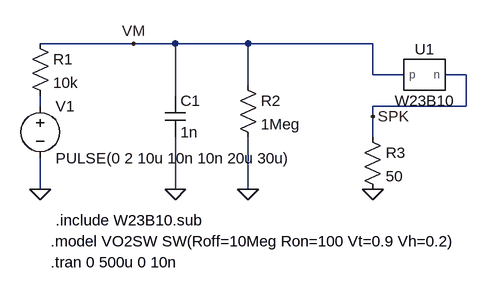
[diagram p0: schematic lif-tiox.asc]
lif-tiox.asc, the LTspice schematic file:
Version 4
SHEET 1 880 680
WIRE 224 128 80 128
WIRE 288 128 224 128
WIRE 400 128 288 128
WIRE 592 128 400 128
WIRE 592 176 592 128
WIRE 640 176 592 176
WIRE 736 176 704 176
WIRE 400 192 400 128
WIRE 288 208 288 128
WIRE 80 224 80 208
WIRE 736 224 736 176
WIRE 736 224 592 224
WIRE 592 240 592 224
WIRE 592 272 592 240
WIRE 80 352 80 304
WIRE 288 352 288 272
WIRE 400 352 400 272
FLAG 80 352 0
FLAG 288 352 0
FLAG 400 352 0
FLAG 592 352 0
FLAG 224 128 VM
FLAG 592 240 SPK
SYMBOL voltage 80 208 R0
WINDOW 123 0 0 Left 0
WINDOW 39 0 0 Left 0
SYMATTR InstName V1
SYMATTR Value PULSE(0 2 10u 10n 10n 20u 30u)
SYMBOL res 64 112 R0
SYMATTR InstName R1
SYMATTR Value 10k
SYMBOL cap 272 208 R0
SYMATTR InstName C1
SYMATTR Value 1n
SYMBOL res 384 176 R0
SYMATTR InstName R2
SYMATTR Value 1Meg
SYMBOL res 576 256 R0
SYMATTR InstName R3
SYMATTR Value 50
SYMBOL W23B10 672 176 R0
SYMATTR InstName U1
TEXT 96 432 Left 2 !.model VO2SW SW(Roff=10Meg Ron=100 Vt=0.9 Vh=0.2)
TEXT 96 464 Left 2 !.tran 0 500u 0 10n
TEXT 104 400 Left 2 !.include W23B10.sub

The netlist it stands for:
* lif-tiox.asc
V1 N001 0 PULSE(0 2 10u 10n 10n 20u 30u)
R1 VM N001 10k
C1 VM 0 1n
R2 VM 0 1Meg
R3 SPK 0 50
XU1 VM SPK W23B10  ; pins p n
.model VO2SW SW(Roff=10Meg Ron=100 Vt=0.9 Vh=0.2)
.tran 0 500u 0 10n
.include W23B10.sub
.lib /Users/jamescarlyle/com.github/jamescarlyle/phd/simulation/lif-tiox/W23B10.sub
.backanno
.end